# Altium project 5-SignalLight.PrjPcb (part 2 of 2)

## Sheet signal-light-10.SchDoc
size A4; SheetNumber: 13; SheetTotal: 21
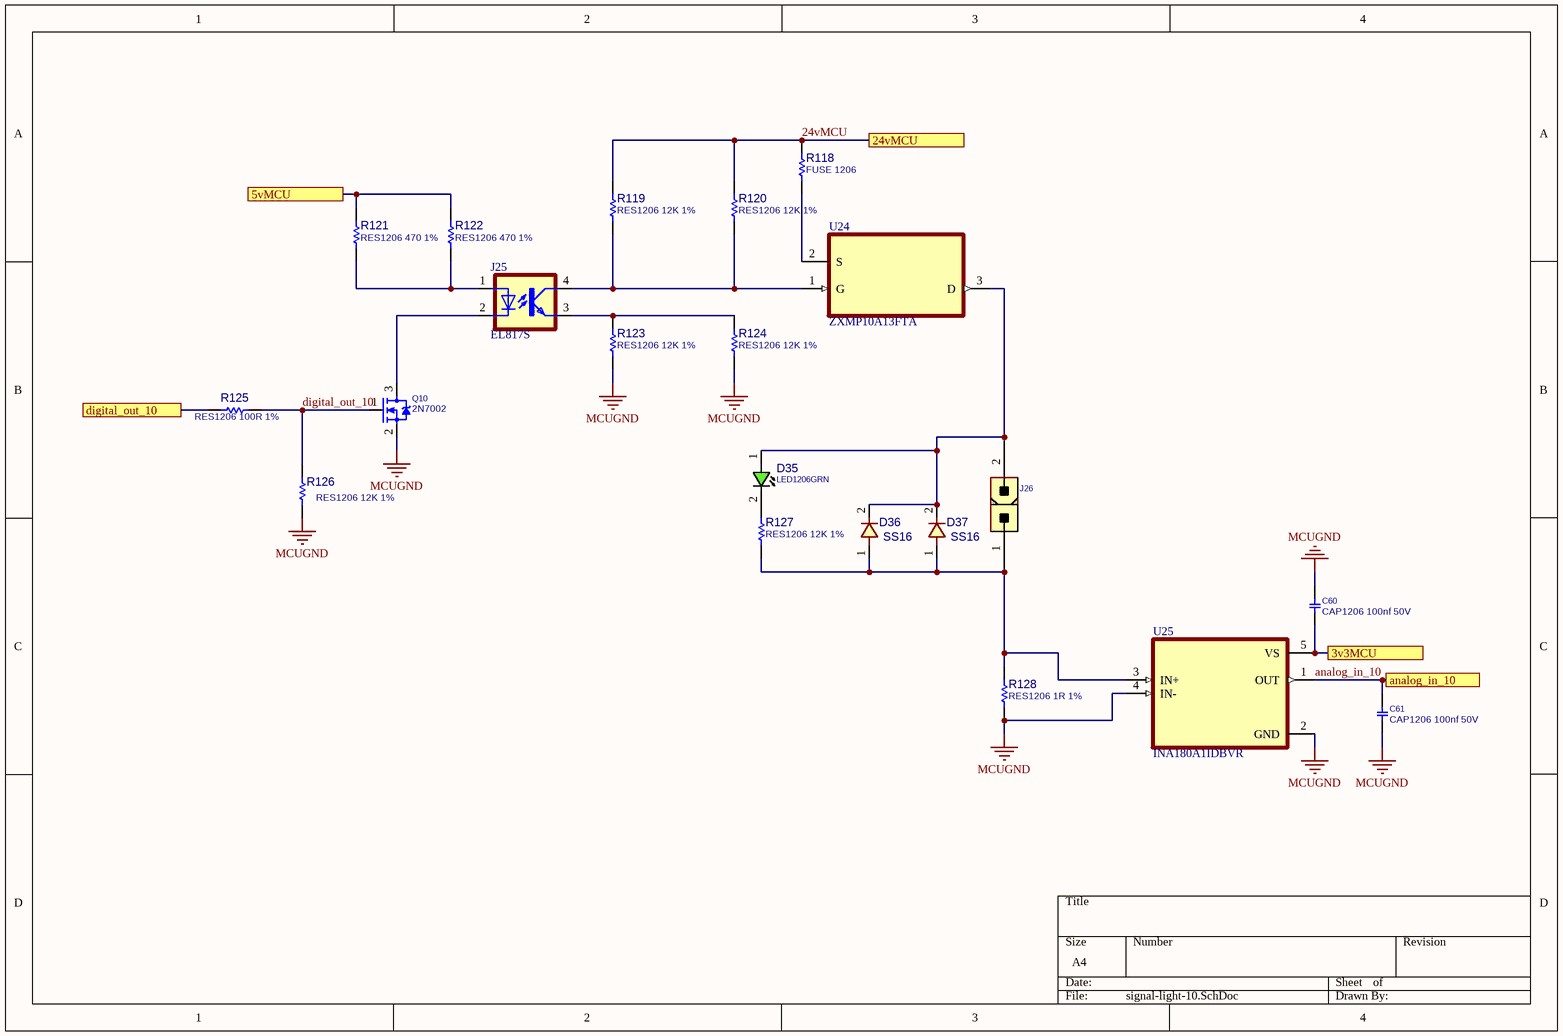
[diagram p12: signal-light-10.SchDoc]

### Parts
C60  CAP1206 100nf 50V  [C1206]
C61  CAP1206 100nf 50V  [C1206]
D35  LED1206GRN  [LED1206GRN]
D36  SS16  [D_SMA]
D37  SS16  [D_SMA]
J25  EL817S  [SOIC254P1030X460-4N]
J26  CONN_ATXPWR_2  [ATXPWR_2]  (value not drawn)
Q10  2N7002  [SOT23_3]
R118  FUSE 1206  [R1206]
R119  RES1206 12K 1%  [R1206]
R120  RES1206 12K 1%  [R1206]
R121  RES1206 470 1%  [R1206]
R122  RES1206 470 1%  [R1206]
R123  RES1206 12K 1%  [R1206]
R124  RES1206 12K 1%  [R1206]
R125  RES1206 100R 1%  [R1206]
R126  RES1206 12K 1%  [R1206]
R127  RES1206 12K 1%  [R1206]
R128  RES1206 1R 1%  [R1206]
U24  ZXMP10A13FTA  [SOT95P230X110-3N]
U25  INA180A1IDBVR  [SOT95P280X145-5N]

### Ports
3v3MCU, 5vMCU, 24vMCU, analog_in_10, digital_out_10

### Nets
MCUGND: C60.1 C61.2 Q10.2(SOURCE) R123.2 R124.2 R126.2 R128.2 U25.2(GND) U25.4(IN-)
3v3MCU: C60.2 U25.5(VS) ; port 3v3MCU
5vMCU: R121.2 R122.2 ; port 5vMCU
24vMCU: R118.1 R119.1 R120.1 ; port 24vMCU
analog_in_10: C61.1 U25.1(OUT) ; port analog_in_10
digital_out_10: Q10.1(GATE) R125.2 R126.1
NetD35_1: D35.1(ANODE) D36.2 D37.2 J26.2 U24.3(D)
NetD35_2: D35.2(CATHODE) R127.1
NetD36_1: D36.1 D37.1 J26.1 R127.2 R128.1 U25.3(IN+)
NetJ25_1: J25.1(A) R121.1 R122.1
NetJ25_2: J25.2(C) Q10.3(DRAIN)
NetJ25_3: J25.3(EMIT) R123.1 R124.1
NetJ25_4: J25.4(COL) R119.2 R120.2 U24.1(G)
NetR118_2: R118.2 U24.2(S)
NetR125_1: R125.1 ; port digital_out_10

### Library data of the parts
C60 C61 = CAP_SMD_MLCC_1206: CAP, MLCC; PARAM: -, -%; MANF_P#: MANF_PART#; PARAM2: -V; PRICE: 100= 1$; MANF: -; ASSEMBLY: ASSEMBLY
D35 = LED_SMD_1206_GRN: LED, SMD, 1206, GREEN; PARAM: 20mA; DESC: DESCRIPTION; PARAM2: 2.2V; MANF: -; ASSEMBLY: ASSEMBLY; PRICE: 36t@Javan; MANF_P#: -; VALUE: LED1206GRN; MountType: SMT; PartType: LED
D36 D37 = DIODE_SMD_1N4001: DIODE, GENERAL PURPOSE, 50V/1A; DESC: DESCRIPTION; PARAM: 50V VRRM; PARAM2: 1A; MANF_P#: 1N4001; MANF: MANF; ASSEMBLY: ASSEMBLY; PRICE: PRICE; VALUE: SS16
J25 = EL817S: Optoisolator Transistor Output 5000Vrms 1 Channel 4-SMD; MF: Everlight Electronics; SnapEDA_Link: https://www.snapeda.com/parts/EL817S/Everlight+Electronics+Co+Ltd/view-part/?ref=snap; Package: SMD-4 Everlight Electronics Co Ltd; Value: *; MP: EL817S; Check_prices: https://www.snapeda.com/parts/EL817S/Everlight+Electronics+Co+Ltd/view-part/?ref=eda
J26 = CONN_ATXPWR_2: CONN, ATX POWER, 2 P; MANF: Molex; MANF_P#: 39281023; VALUE: CONN_ATXPWR_2; MountType: THD; PACKAGE: ATXPWR-2pin; Part Type: Conn.
Q10 = MOSN_2N7002_SOT23: MOSFET, N-CH, 60V, 0.3A; MANF: NXP; ASSEMBLY: ASSEMBLY; MANF_P#: 2N7002; PARAM2: 60v; PARAM: 0.3A; PRICE: 0.3t@Javan; VALUE: 2N7002
R118-R128 = RES_SMD_1206: RESISTOR, SMD; PARAM: 1%, 0.25W; DESC: DESCRIPTION; DIST#: MOUSER; MANF_P#: -; MANF: -; ASSEMBLY: ASSEMBLY; PRICE: -; PARAM2: -
U24 = ZXMP10A13FTA: P-Channel 100 V 600mA (Ta) 625mW (Ta) Surface Mount SOT-23-3; MF: Diodes Inc.; Purchase-URL: https://pricing.snapeda.com/search/part/ZXMP10A13FTA/?ref=eda; Package: SOT-23-3 Diodes Inc.; SnapEDA_Link: https://www.snapeda.com/parts/ZXMP10A13FTA/Diodes+Inc./view-part/?ref=snap; Availability: In Stock; Value: *; MP: ZXMP10A13FTA; Check_prices: https://www.snapeda.com/parts/ZXMP10A13FTA/Diodes+Inc./view-part/?ref=eda; Price: None
U25 = INA180A1IDBVR: 26V, 350kHz current sense amplifier; MF: Texas Instruments; SnapEDA_Link: https://www.snapeda.com/parts/INA180A1IDBVR/Texas+Instruments/view-part/?ref=snap; Package: SOT-23-5 Texas Instruments; Value: *; MP: INA180A1IDBVR; Check_prices: https://www.snapeda.com/parts/INA180A1IDBVR/Texas+Instruments/view-part/?ref=eda

## Sheet signal-light-11.SchDoc
size A4; SheetNumber: 14; SheetTotal: 21
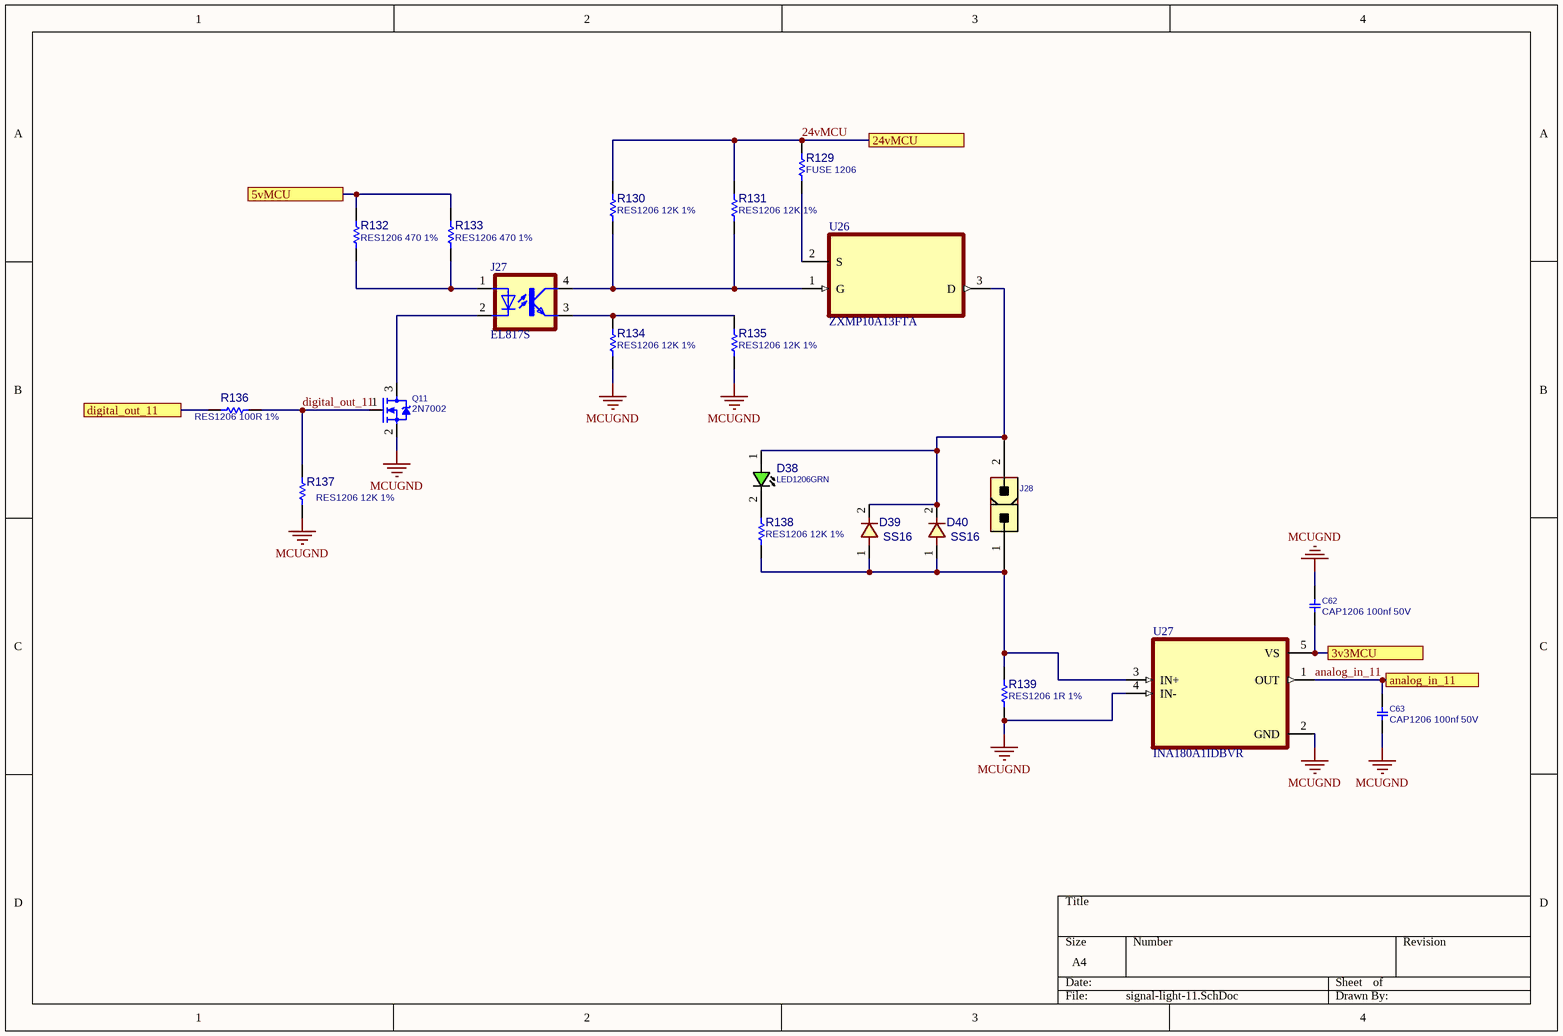
[diagram p13: signal-light-11.SchDoc]

### Parts
C62  CAP1206 100nf 50V  [C1206]
C63  CAP1206 100nf 50V  [C1206]
D38  LED1206GRN  [LED1206GRN]
D39  SS16  [D_SMA]
D40  SS16  [D_SMA]
J27  EL817S  [SOIC254P1030X460-4N]
J28  CONN_ATXPWR_2  [ATXPWR_2]  (value not drawn)
Q11  2N7002  [SOT23_3]
R129  FUSE 1206  [R1206]
R130  RES1206 12K 1%  [R1206]
R131  RES1206 12K 1%  [R1206]
R132  RES1206 470 1%  [R1206]
R133  RES1206 470 1%  [R1206]
R134  RES1206 12K 1%  [R1206]
R135  RES1206 12K 1%  [R1206]
R136  RES1206 100R 1%  [R1206]
R137  RES1206 12K 1%  [R1206]
R138  RES1206 12K 1%  [R1206]
R139  RES1206 1R 1%  [R1206]
U26  ZXMP10A13FTA  [SOT95P230X110-3N]
U27  INA180A1IDBVR  [SOT95P280X145-5N]

### Ports
3v3MCU, 5vMCU, 24vMCU, analog_in_11, digital_out_11

### Nets
MCUGND: C62.1 C63.2 Q11.2(SOURCE) R134.2 R135.2 R137.2 R139.2 U27.2(GND) U27.4(IN-)
3v3MCU: C62.2 U27.5(VS) ; port 3v3MCU
5vMCU: R132.2 R133.2 ; port 5vMCU
24vMCU: R129.1 R130.1 R131.1 ; port 24vMCU
analog_in_11: C63.1 U27.1(OUT) ; port analog_in_11
digital_out_11: Q11.1(GATE) R136.2 R137.1
NetD38_1: D38.1(ANODE) D39.2 D40.2 J28.2 U26.3(D)
NetD38_2: D38.2(CATHODE) R138.1
NetD39_1: D39.1 D40.1 J28.1 R138.2 R139.1 U27.3(IN+)
NetJ27_1: J27.1(A) R132.1 R133.1
NetJ27_2: J27.2(C) Q11.3(DRAIN)
NetJ27_3: J27.3(EMIT) R134.1 R135.1
NetJ27_4: J27.4(COL) R130.2 R131.2 U26.1(G)
NetR129_2: R129.2 U26.2(S)
NetR136_1: R136.1 ; port digital_out_11

### Library data of the parts
C62 C63 = CAP_SMD_MLCC_1206: as C60 on sheet signal-light-10; PRICE: 100= 1$; MANF: -; ASSEMBLY: ASSEMBLY
D38 = LED_SMD_1206_GRN: as D35 on sheet signal-light-10; MANF: -; ASSEMBLY: ASSEMBLY; PRICE: 36t@Javan; MANF_P#: -; VALUE: LED1206GRN; MountType: SMT; PartType: LED
D39 D40 = DIODE_SMD_1N4001: as D36 on sheet signal-light-10; MANF: MANF; ASSEMBLY: ASSEMBLY; PRICE: PRICE; VALUE: SS16
J27 = EL817S: as J25 on sheet signal-light-10; SnapEDA_Link: https://www.snapeda.com/parts/EL817S/Everlight+Electronics+Co+Ltd/view-part/?ref=snap; Package: SMD-4 Everlight Electronics Co Ltd; Value: *; MP: EL817S; Check_prices: https://www.snapeda.com/parts/EL817S/Everlight+Electronics+Co+Ltd/view-part/?ref=eda
J28 = CONN_ATXPWR_2: as J26 on sheet signal-light-10; VALUE: CONN_ATXPWR_2; MountType: THD; PACKAGE: ATXPWR-2pin; Part Type: Conn.
Q11 = MOSN_2N7002_SOT23: MOSFET, N-CH, 60V, 0.3A; MANF: NXP; ASSEMBLY: ASSEMBLY; MANF_P#: 2N7002; PARAM2: 60v; PARAM: 0.3A; PRICE: 0.3t@Javan; VALUE: 2N7002
R129-R139 = RES_SMD_1206: as R118 on sheet signal-light-10; MANF_P#: -; MANF: -; ASSEMBLY: ASSEMBLY; PRICE: -; PARAM2: -
U26 = ZXMP10A13FTA: as U24 on sheet signal-light-10; Purchase-URL: https://pricing.snapeda.com/search/part/ZXMP10A13FTA/?ref=eda; Package: SOT-23-3 Diodes Inc.; SnapEDA_Link: https://www.snapeda.com/parts/ZXMP10A13FTA/Diodes+Inc./view-part/?ref=snap; Availability: In Stock; Value: *; MP: ZXMP10A13FTA; Check_prices: https://www.snapeda.com/parts/ZXMP10A13FTA/Diodes+Inc./view-part/?ref=eda; Price: None
U27 = INA180A1IDBVR: as U25 on sheet signal-light-10; SnapEDA_Link: https://www.snapeda.com/parts/INA180A1IDBVR/Texas+Instruments/view-part/?ref=snap; Package: SOT-23-5 Texas Instruments; Value: *; MP: INA180A1IDBVR; Check_prices: https://www.snapeda.com/parts/INA180A1IDBVR/Texas+Instruments/view-part/?ref=eda

## Sheet signal-light-12.SchDoc
size A4; SheetNumber: 15; SheetTotal: 21
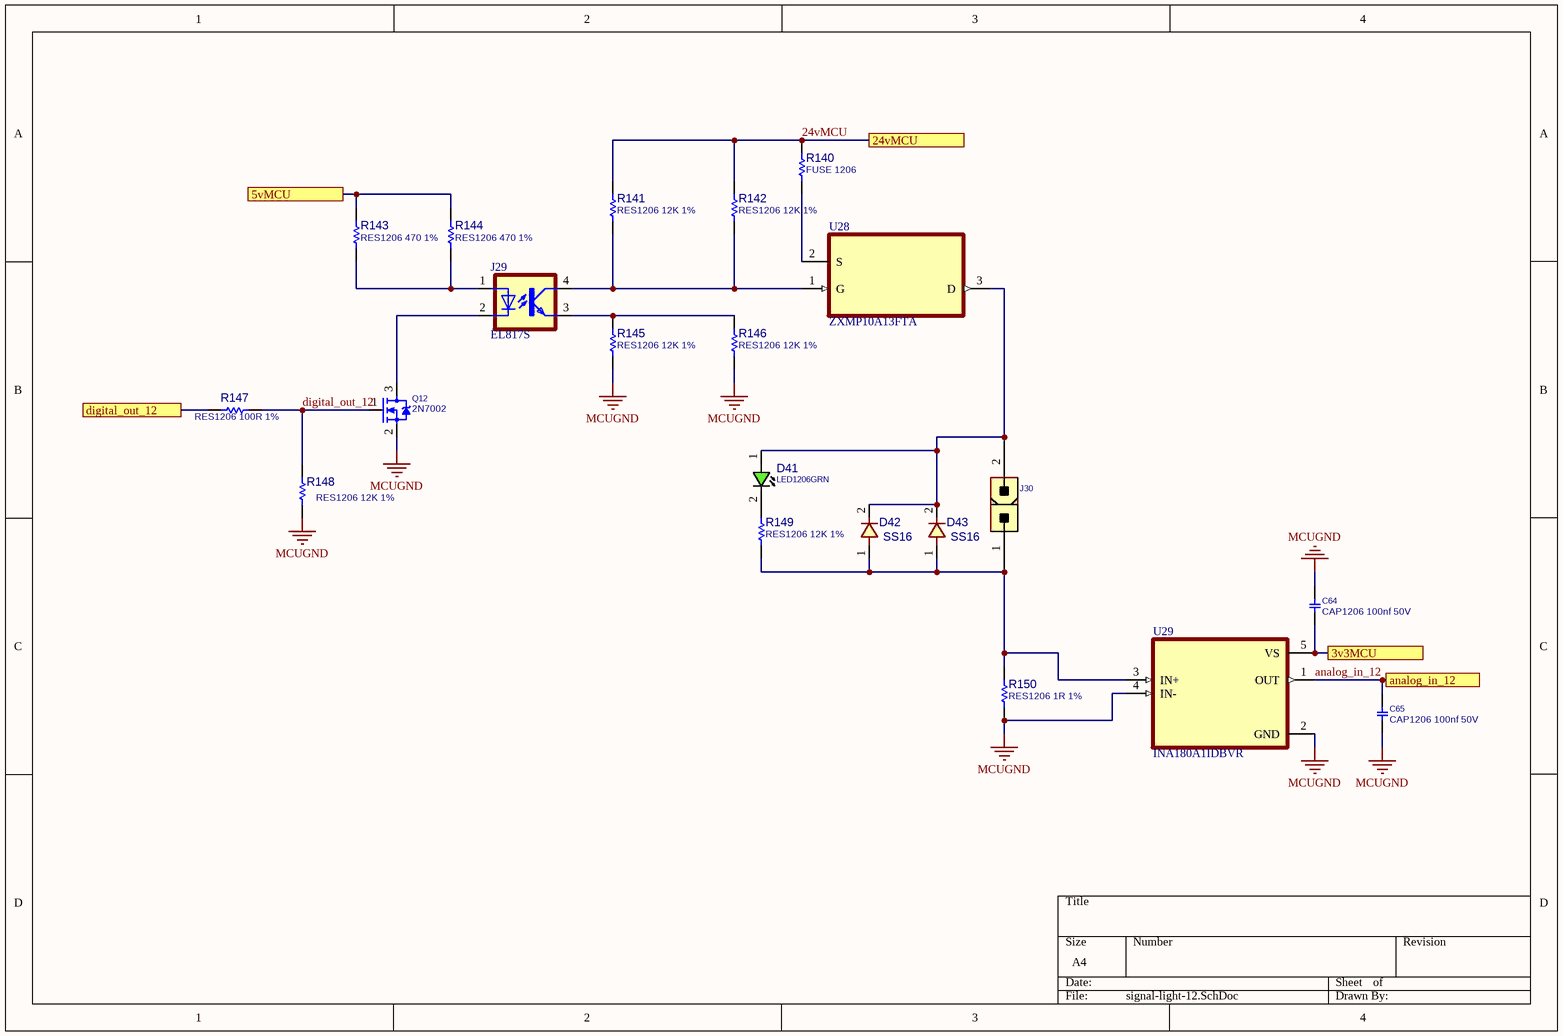
[diagram p14: signal-light-12.SchDoc]

### Parts
C64  CAP1206 100nf 50V  [C1206]
C65  CAP1206 100nf 50V  [C1206]
D41  LED1206GRN  [LED1206GRN]
D42  SS16  [D_SMA]
D43  SS16  [D_SMA]
J29  EL817S  [SOIC254P1030X460-4N]
J30  CONN_ATXPWR_2  [ATXPWR_2]  (value not drawn)
Q12  2N7002  [SOT23_3]
R140  FUSE 1206  [R1206]
R141  RES1206 12K 1%  [R1206]
R142  RES1206 12K 1%  [R1206]
R143  RES1206 470 1%  [R1206]
R144  RES1206 470 1%  [R1206]
R145  RES1206 12K 1%  [R1206]
R146  RES1206 12K 1%  [R1206]
R147  RES1206 100R 1%  [R1206]
R148  RES1206 12K 1%  [R1206]
R149  RES1206 12K 1%  [R1206]
R150  RES1206 1R 1%  [R1206]
U28  ZXMP10A13FTA  [SOT95P230X110-3N]
U29  INA180A1IDBVR  [SOT95P280X145-5N]

### Ports
3v3MCU, 5vMCU, 24vMCU, analog_in_12, digital_out_12

### Nets
MCUGND: C64.1 C65.2 Q12.2(SOURCE) R145.2 R146.2 R148.2 R150.2 U29.2(GND) U29.4(IN-)
3v3MCU: C64.2 U29.5(VS) ; port 3v3MCU
5vMCU: R143.2 R144.2 ; port 5vMCU
24vMCU: R140.1 R141.1 R142.1 ; port 24vMCU
analog_in_12: C65.1 U29.1(OUT) ; port analog_in_12
digital_out_12: Q12.1(GATE) R147.2 R148.1
NetD41_1: D41.1(ANODE) D42.2 D43.2 J30.2 U28.3(D)
NetD41_2: D41.2(CATHODE) R149.1
NetD42_1: D42.1 D43.1 J30.1 R149.2 R150.1 U29.3(IN+)
NetJ29_1: J29.1(A) R143.1 R144.1
NetJ29_2: J29.2(C) Q12.3(DRAIN)
NetJ29_3: J29.3(EMIT) R145.1 R146.1
NetJ29_4: J29.4(COL) R141.2 R142.2 U28.1(G)
NetR140_2: R140.2 U28.2(S)
NetR147_1: R147.1 ; port digital_out_12

### Library data of the parts
C64 C65 = CAP_SMD_MLCC_1206: as C60 on sheet signal-light-10; PRICE: 100= 1$; MANF: -; ASSEMBLY: ASSEMBLY
D41 = LED_SMD_1206_GRN: as D35 on sheet signal-light-10; MANF: -; ASSEMBLY: ASSEMBLY; PRICE: 36t@Javan; MANF_P#: -; VALUE: LED1206GRN; MountType: SMT; PartType: LED
D42 D43 = DIODE_SMD_1N4001: as D36 on sheet signal-light-10; MANF: MANF; ASSEMBLY: ASSEMBLY; PRICE: PRICE; VALUE: SS16
J29 = EL817S: as J25 on sheet signal-light-10; SnapEDA_Link: https://www.snapeda.com/parts/EL817S/Everlight+Electronics+Co+Ltd/view-part/?ref=snap; Package: SMD-4 Everlight Electronics Co Ltd; Value: *; MP: EL817S; Check_prices: https://www.snapeda.com/parts/EL817S/Everlight+Electronics+Co+Ltd/view-part/?ref=eda
J30 = CONN_ATXPWR_2: as J26 on sheet signal-light-10; VALUE: CONN_ATXPWR_2; MountType: THD; PACKAGE: ATXPWR-2pin; Part Type: Conn.
Q12 = MOSN_2N7002_SOT23: MOSFET, N-CH, 60V, 0.3A; MANF: NXP; ASSEMBLY: ASSEMBLY; MANF_P#: 2N7002; PARAM2: 60v; PARAM: 0.3A; PRICE: 0.3t@Javan; VALUE: 2N7002
R140-R150 = RES_SMD_1206: as R118 on sheet signal-light-10; MANF_P#: -; MANF: -; ASSEMBLY: ASSEMBLY; PRICE: -; PARAM2: -
U28 = ZXMP10A13FTA: as U24 on sheet signal-light-10; Purchase-URL: https://pricing.snapeda.com/search/part/ZXMP10A13FTA/?ref=eda; Package: SOT-23-3 Diodes Inc.; SnapEDA_Link: https://www.snapeda.com/parts/ZXMP10A13FTA/Diodes+Inc./view-part/?ref=snap; Availability: In Stock; Value: *; MP: ZXMP10A13FTA; Check_prices: https://www.snapeda.com/parts/ZXMP10A13FTA/Diodes+Inc./view-part/?ref=eda; Price: None
U29 = INA180A1IDBVR: as U25 on sheet signal-light-10; SnapEDA_Link: https://www.snapeda.com/parts/INA180A1IDBVR/Texas+Instruments/view-part/?ref=snap; Package: SOT-23-5 Texas Instruments; Value: *; MP: INA180A1IDBVR; Check_prices: https://www.snapeda.com/parts/INA180A1IDBVR/Texas+Instruments/view-part/?ref=eda

## Sheet signal-light-13.SchDoc
size A4; SheetNumber: 16; SheetTotal: 21
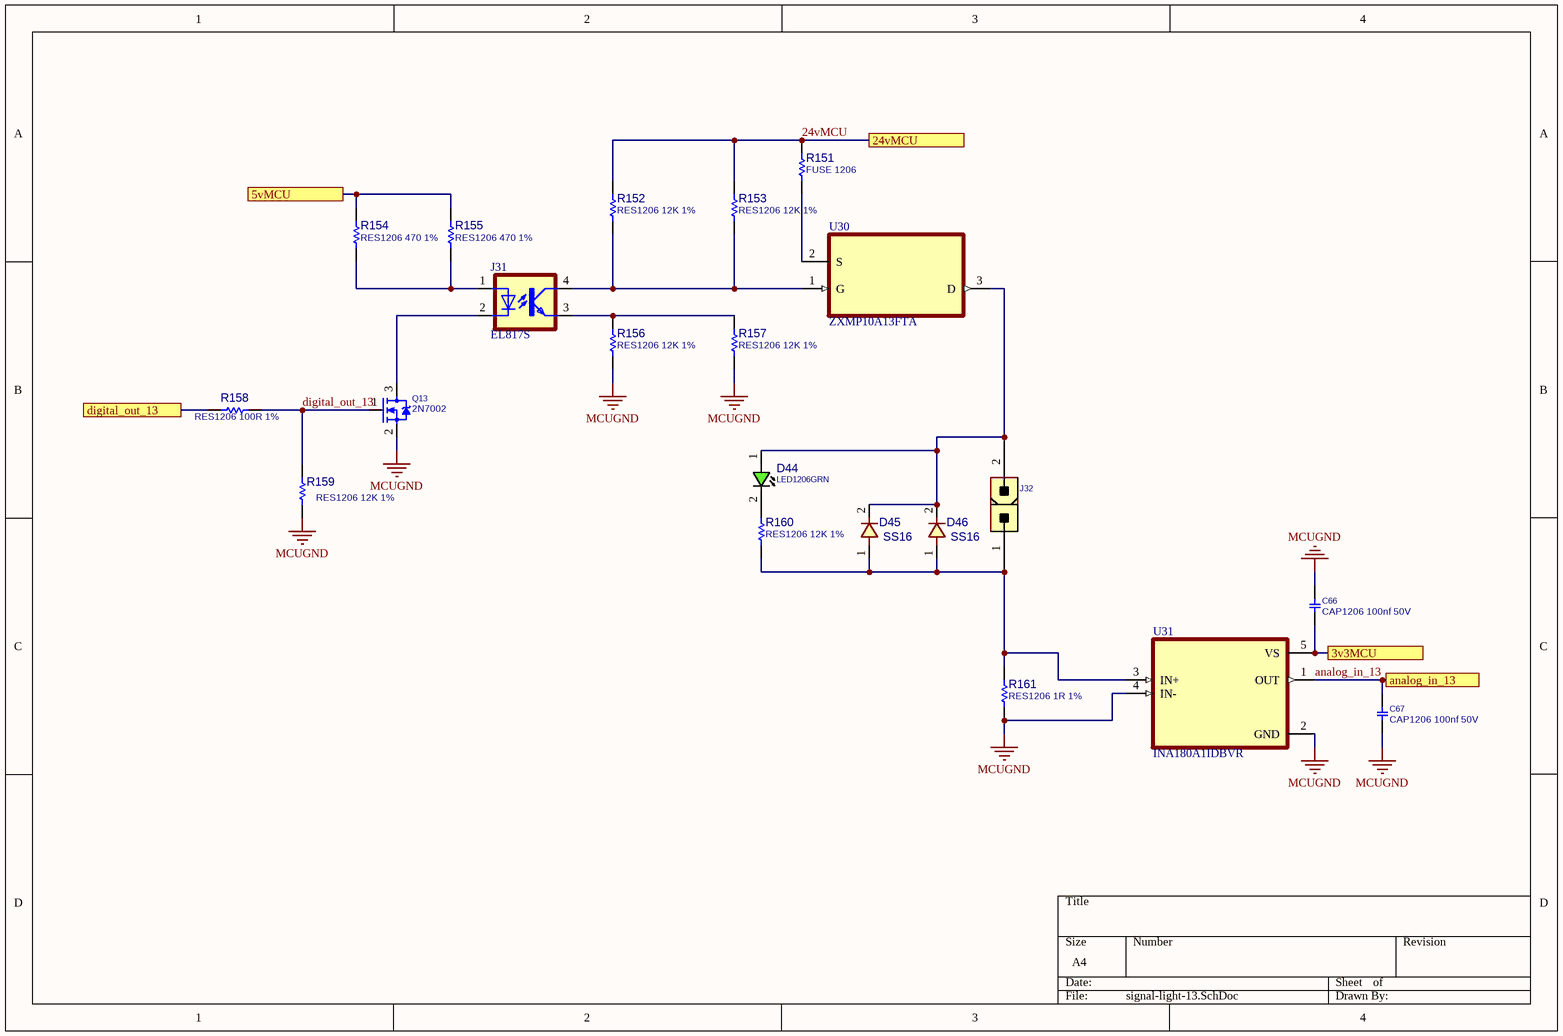
[diagram p15: signal-light-13.SchDoc]

### Parts
C66  CAP1206 100nf 50V  [C1206]
C67  CAP1206 100nf 50V  [C1206]
D44  LED1206GRN  [LED1206GRN]
D45  SS16  [D_SMA]
D46  SS16  [D_SMA]
J31  EL817S  [SOIC254P1030X460-4N]
J32  CONN_ATXPWR_2  [ATXPWR_2]  (value not drawn)
Q13  2N7002  [SOT23_3]
R151  FUSE 1206  [R1206]
R152  RES1206 12K 1%  [R1206]
R153  RES1206 12K 1%  [R1206]
R154  RES1206 470 1%  [R1206]
R155  RES1206 470 1%  [R1206]
R156  RES1206 12K 1%  [R1206]
R157  RES1206 12K 1%  [R1206]
R158  RES1206 100R 1%  [R1206]
R159  RES1206 12K 1%  [R1206]
R160  RES1206 12K 1%  [R1206]
R161  RES1206 1R 1%  [R1206]
U30  ZXMP10A13FTA  [SOT95P230X110-3N]
U31  INA180A1IDBVR  [SOT95P280X145-5N]

### Ports
3v3MCU, 5vMCU, 24vMCU, analog_in_13, digital_out_13

### Nets
MCUGND: C66.1 C67.2 Q13.2(SOURCE) R156.2 R157.2 R159.2 R161.2 U31.2(GND) U31.4(IN-)
3v3MCU: C66.2 U31.5(VS) ; port 3v3MCU
5vMCU: R154.2 R155.2 ; port 5vMCU
24vMCU: R151.1 R152.1 R153.1 ; port 24vMCU
analog_in_13: C67.1 U31.1(OUT) ; port analog_in_13
digital_out_13: Q13.1(GATE) R158.2 R159.1
NetD44_1: D44.1(ANODE) D45.2 D46.2 J32.2 U30.3(D)
NetD44_2: D44.2(CATHODE) R160.1
NetD45_1: D45.1 D46.1 J32.1 R160.2 R161.1 U31.3(IN+)
NetJ31_1: J31.1(A) R154.1 R155.1
NetJ31_2: J31.2(C) Q13.3(DRAIN)
NetJ31_3: J31.3(EMIT) R156.1 R157.1
NetJ31_4: J31.4(COL) R152.2 R153.2 U30.1(G)
NetR151_2: R151.2 U30.2(S)
NetR158_1: R158.1 ; port digital_out_13

### Library data of the parts
C66 C67 = CAP_SMD_MLCC_1206: as C60 on sheet signal-light-10; PRICE: 100= 1$; MANF: -; ASSEMBLY: ASSEMBLY
D44 = LED_SMD_1206_GRN: as D35 on sheet signal-light-10; MANF: -; ASSEMBLY: ASSEMBLY; PRICE: 36t@Javan; MANF_P#: -; VALUE: LED1206GRN; MountType: SMT; PartType: LED
D45 D46 = DIODE_SMD_1N4001: as D36 on sheet signal-light-10; MANF: MANF; ASSEMBLY: ASSEMBLY; PRICE: PRICE; VALUE: SS16
J31 = EL817S: as J25 on sheet signal-light-10; SnapEDA_Link: https://www.snapeda.com/parts/EL817S/Everlight+Electronics+Co+Ltd/view-part/?ref=snap; Package: SMD-4 Everlight Electronics Co Ltd; Value: *; MP: EL817S; Check_prices: https://www.snapeda.com/parts/EL817S/Everlight+Electronics+Co+Ltd/view-part/?ref=eda
J32 = CONN_ATXPWR_2: as J26 on sheet signal-light-10; VALUE: CONN_ATXPWR_2; MountType: THD; PACKAGE: ATXPWR-2pin; Part Type: Conn.
Q13 = MOSN_2N7002_SOT23: MOSFET, N-CH, 60V, 0.3A; MANF: NXP; ASSEMBLY: ASSEMBLY; MANF_P#: 2N7002; PARAM2: 60v; PARAM: 0.3A; PRICE: 0.3t@Javan; VALUE: 2N7002
R151-R161 = RES_SMD_1206: as R118 on sheet signal-light-10; MANF_P#: -; MANF: -; ASSEMBLY: ASSEMBLY; PRICE: -; PARAM2: -
U30 = ZXMP10A13FTA: as U24 on sheet signal-light-10; Purchase-URL: https://pricing.snapeda.com/search/part/ZXMP10A13FTA/?ref=eda; Package: SOT-23-3 Diodes Inc.; SnapEDA_Link: https://www.snapeda.com/parts/ZXMP10A13FTA/Diodes+Inc./view-part/?ref=snap; Availability: In Stock; Value: *; MP: ZXMP10A13FTA; Check_prices: https://www.snapeda.com/parts/ZXMP10A13FTA/Diodes+Inc./view-part/?ref=eda; Price: None
U31 = INA180A1IDBVR: as U25 on sheet signal-light-10; SnapEDA_Link: https://www.snapeda.com/parts/INA180A1IDBVR/Texas+Instruments/view-part/?ref=snap; Package: SOT-23-5 Texas Instruments; Value: *; MP: INA180A1IDBVR; Check_prices: https://www.snapeda.com/parts/INA180A1IDBVR/Texas+Instruments/view-part/?ref=eda

## Sheet signal-light-14.SchDoc
size A4; SheetNumber: 17; SheetTotal: 21
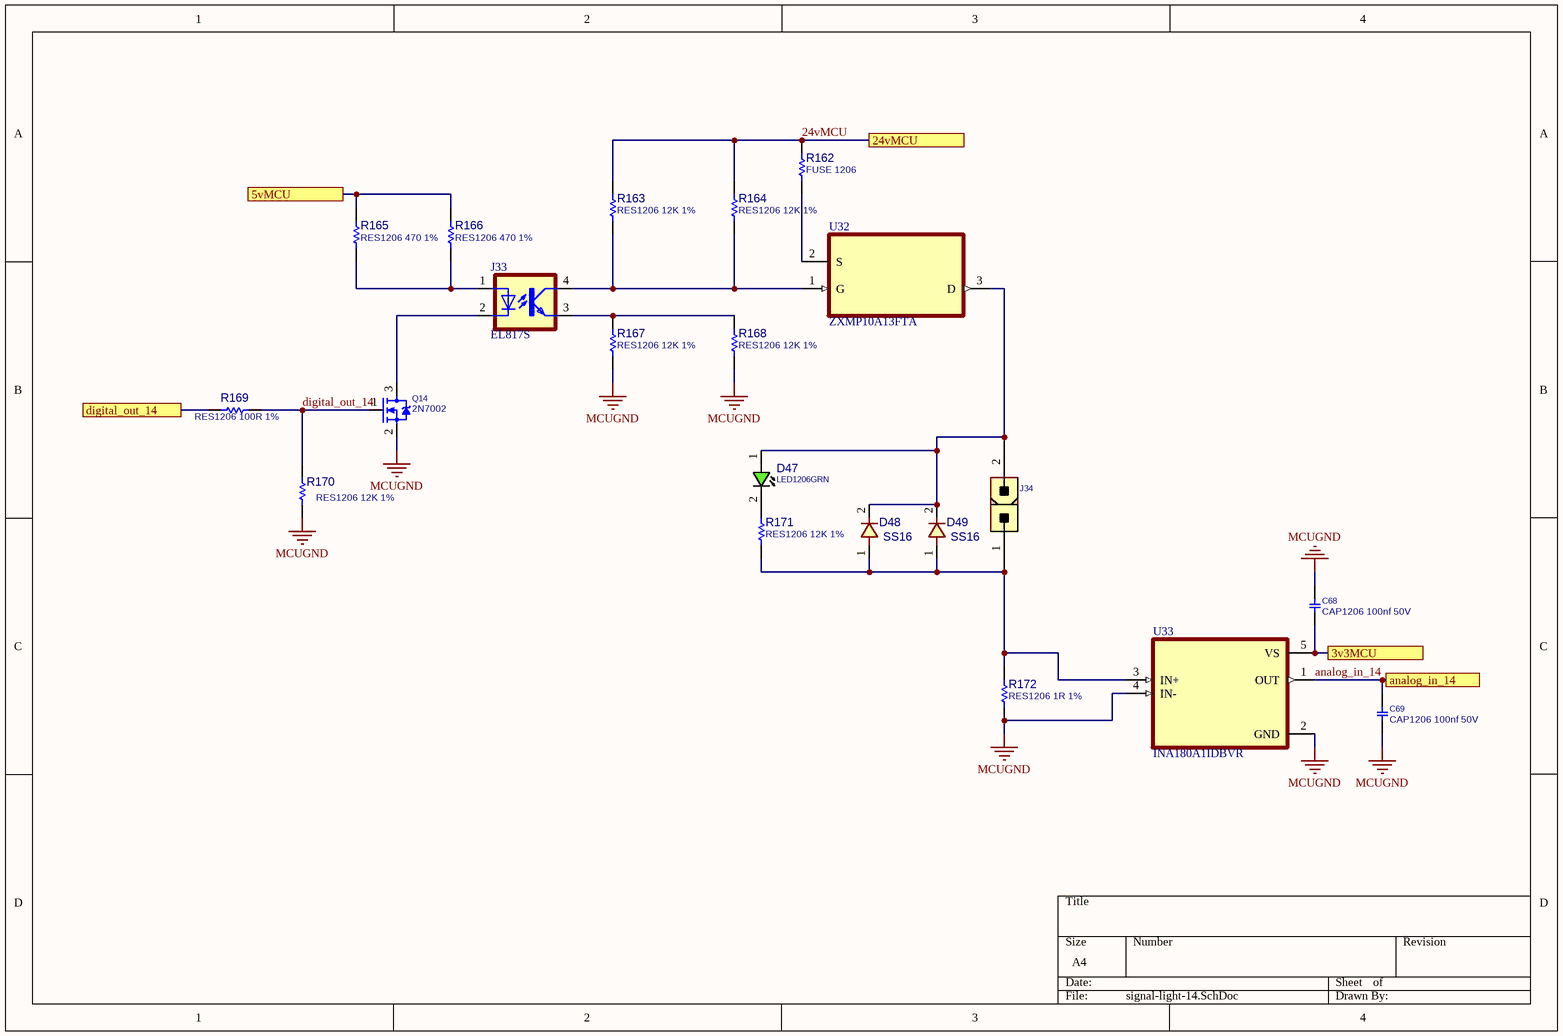
[diagram p16: signal-light-14.SchDoc]

### Parts
C68  CAP1206 100nf 50V  [C1206]
C69  CAP1206 100nf 50V  [C1206]
D47  LED1206GRN  [LED1206GRN]
D48  SS16  [D_SMA]
D49  SS16  [D_SMA]
J33  EL817S  [SOIC254P1030X460-4N]
J34  CONN_ATXPWR_2  [ATXPWR_2]  (value not drawn)
Q14  2N7002  [SOT23_3]
R162  FUSE 1206  [R1206]
R163  RES1206 12K 1%  [R1206]
R164  RES1206 12K 1%  [R1206]
R165  RES1206 470 1%  [R1206]
R166  RES1206 470 1%  [R1206]
R167  RES1206 12K 1%  [R1206]
R168  RES1206 12K 1%  [R1206]
R169  RES1206 100R 1%  [R1206]
R170  RES1206 12K 1%  [R1206]
R171  RES1206 12K 1%  [R1206]
R172  RES1206 1R 1%  [R1206]
U32  ZXMP10A13FTA  [SOT95P230X110-3N]
U33  INA180A1IDBVR  [SOT95P280X145-5N]

### Ports
3v3MCU, 5vMCU, 24vMCU, analog_in_14, digital_out_14

### Nets
MCUGND: C68.1 C69.2 Q14.2(SOURCE) R167.2 R168.2 R170.2 R172.2 U33.2(GND) U33.4(IN-)
3v3MCU: C68.2 U33.5(VS) ; port 3v3MCU
5vMCU: R165.2 R166.2 ; port 5vMCU
24vMCU: R162.1 R163.1 R164.1 ; port 24vMCU
analog_in_14: C69.1 U33.1(OUT) ; port analog_in_14
digital_out_14: Q14.1(GATE) R169.2 R170.1
NetD47_1: D47.1(ANODE) D48.2 D49.2 J34.2 U32.3(D)
NetD47_2: D47.2(CATHODE) R171.1
NetD48_1: D48.1 D49.1 J34.1 R171.2 R172.1 U33.3(IN+)
NetJ33_1: J33.1(A) R165.1 R166.1
NetJ33_2: J33.2(C) Q14.3(DRAIN)
NetJ33_3: J33.3(EMIT) R167.1 R168.1
NetJ33_4: J33.4(COL) R163.2 R164.2 U32.1(G)
NetR162_2: R162.2 U32.2(S)
NetR169_1: R169.1 ; port digital_out_14

### Library data of the parts
C68 C69 = CAP_SMD_MLCC_1206: as C60 on sheet signal-light-10; PRICE: 100= 1$; MANF: -; ASSEMBLY: ASSEMBLY
D47 = LED_SMD_1206_GRN: as D35 on sheet signal-light-10; MANF: -; ASSEMBLY: ASSEMBLY; PRICE: 36t@Javan; MANF_P#: -; VALUE: LED1206GRN; MountType: SMT; PartType: LED
D48 D49 = DIODE_SMD_1N4001: as D36 on sheet signal-light-10; MANF: MANF; ASSEMBLY: ASSEMBLY; PRICE: PRICE; VALUE: SS16
J33 = EL817S: as J25 on sheet signal-light-10; SnapEDA_Link: https://www.snapeda.com/parts/EL817S/Everlight+Electronics+Co+Ltd/view-part/?ref=snap; Package: SMD-4 Everlight Electronics Co Ltd; Value: *; MP: EL817S; Check_prices: https://www.snapeda.com/parts/EL817S/Everlight+Electronics+Co+Ltd/view-part/?ref=eda
J34 = CONN_ATXPWR_2: as J26 on sheet signal-light-10; VALUE: CONN_ATXPWR_2; MountType: THD; PACKAGE: ATXPWR-2pin; Part Type: Conn.
Q14 = MOSN_2N7002_SOT23: MOSFET, N-CH, 60V, 0.3A; MANF: NXP; ASSEMBLY: ASSEMBLY; MANF_P#: 2N7002; PARAM2: 60v; PARAM: 0.3A; PRICE: 0.3t@Javan; VALUE: 2N7002
R162-R172 = RES_SMD_1206: as R118 on sheet signal-light-10; MANF_P#: -; MANF: -; ASSEMBLY: ASSEMBLY; PRICE: -; PARAM2: -
U32 = ZXMP10A13FTA: as U24 on sheet signal-light-10; Purchase-URL: https://pricing.snapeda.com/search/part/ZXMP10A13FTA/?ref=eda; Package: SOT-23-3 Diodes Inc.; SnapEDA_Link: https://www.snapeda.com/parts/ZXMP10A13FTA/Diodes+Inc./view-part/?ref=snap; Availability: In Stock; Value: *; MP: ZXMP10A13FTA; Check_prices: https://www.snapeda.com/parts/ZXMP10A13FTA/Diodes+Inc./view-part/?ref=eda; Price: None
U33 = INA180A1IDBVR: as U25 on sheet signal-light-10; SnapEDA_Link: https://www.snapeda.com/parts/INA180A1IDBVR/Texas+Instruments/view-part/?ref=snap; Package: SOT-23-5 Texas Instruments; Value: *; MP: INA180A1IDBVR; Check_prices: https://www.snapeda.com/parts/INA180A1IDBVR/Texas+Instruments/view-part/?ref=eda

## Sheet signal-light-15.SchDoc
size A4; SheetNumber: 18; SheetTotal: 21
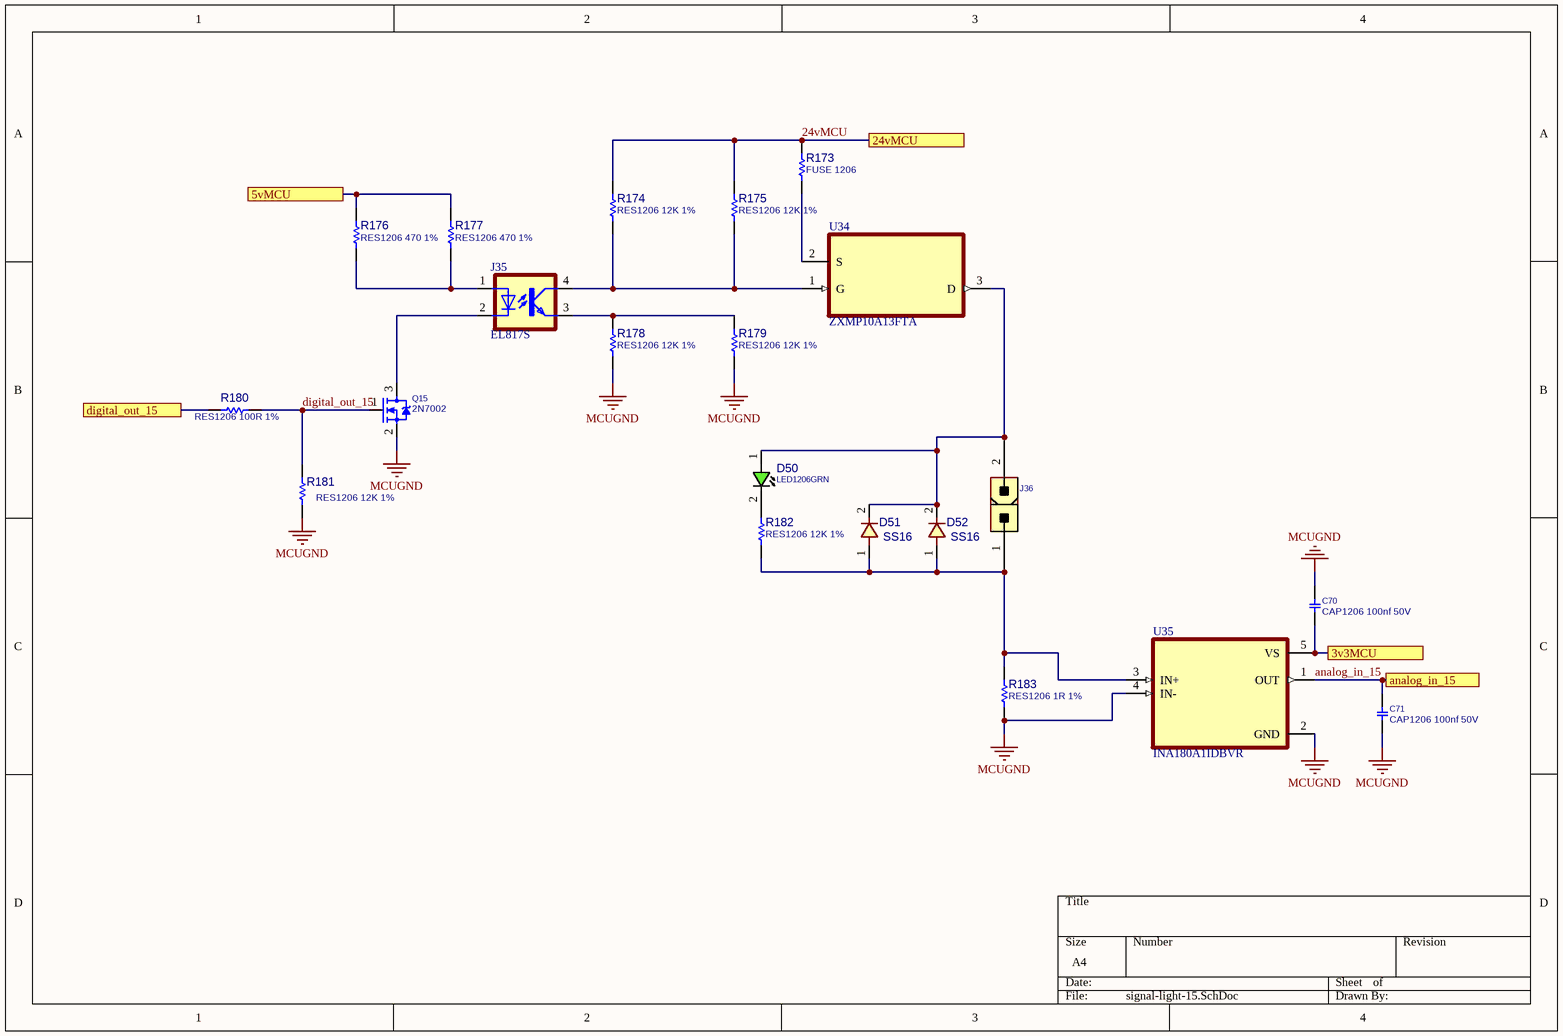
[diagram p17: signal-light-15.SchDoc]

### Parts
C70  CAP1206 100nf 50V  [C1206]
C71  CAP1206 100nf 50V  [C1206]
D50  LED1206GRN  [LED1206GRN]
D51  SS16  [D_SMA]
D52  SS16  [D_SMA]
J35  EL817S  [SOIC254P1030X460-4N]
J36  CONN_ATXPWR_2  [ATXPWR_2]  (value not drawn)
Q15  2N7002  [SOT23_3]
R173  FUSE 1206  [R1206]
R174  RES1206 12K 1%  [R1206]
R175  RES1206 12K 1%  [R1206]
R176  RES1206 470 1%  [R1206]
R177  RES1206 470 1%  [R1206]
R178  RES1206 12K 1%  [R1206]
R179  RES1206 12K 1%  [R1206]
R180  RES1206 100R 1%  [R1206]
R181  RES1206 12K 1%  [R1206]
R182  RES1206 12K 1%  [R1206]
R183  RES1206 1R 1%  [R1206]
U34  ZXMP10A13FTA  [SOT95P230X110-3N]
U35  INA180A1IDBVR  [SOT95P280X145-5N]

### Ports
3v3MCU, 5vMCU, 24vMCU, analog_in_15, digital_out_15

### Nets
MCUGND: C70.1 C71.2 Q15.2(SOURCE) R178.2 R179.2 R181.2 R183.2 U35.2(GND) U35.4(IN-)
3v3MCU: C70.2 U35.5(VS) ; port 3v3MCU
5vMCU: R176.2 R177.2 ; port 5vMCU
24vMCU: R173.1 R174.1 R175.1 ; port 24vMCU
analog_in_15: C71.1 U35.1(OUT) ; port analog_in_15
digital_out_15: Q15.1(GATE) R180.2 R181.1
NetD50_1: D50.1(ANODE) D51.2 D52.2 J36.2 U34.3(D)
NetD50_2: D50.2(CATHODE) R182.1
NetD51_1: D51.1 D52.1 J36.1 R182.2 R183.1 U35.3(IN+)
NetJ35_1: J35.1(A) R176.1 R177.1
NetJ35_2: J35.2(C) Q15.3(DRAIN)
NetJ35_3: J35.3(EMIT) R178.1 R179.1
NetJ35_4: J35.4(COL) R174.2 R175.2 U34.1(G)
NetR173_2: R173.2 U34.2(S)
NetR180_1: R180.1 ; port digital_out_15

### Library data of the parts
C70 C71 = CAP_SMD_MLCC_1206: as C60 on sheet signal-light-10; PRICE: 100= 1$; MANF: -; ASSEMBLY: ASSEMBLY
D50 = LED_SMD_1206_GRN: as D35 on sheet signal-light-10; MANF: -; ASSEMBLY: ASSEMBLY; PRICE: 36t@Javan; MANF_P#: -; VALUE: LED1206GRN; MountType: SMT; PartType: LED
D51 D52 = DIODE_SMD_1N4001: as D36 on sheet signal-light-10; MANF: MANF; ASSEMBLY: ASSEMBLY; PRICE: PRICE; VALUE: SS16
J35 = EL817S: as J25 on sheet signal-light-10; SnapEDA_Link: https://www.snapeda.com/parts/EL817S/Everlight+Electronics+Co+Ltd/view-part/?ref=snap; Package: SMD-4 Everlight Electronics Co Ltd; Value: *; MP: EL817S; Check_prices: https://www.snapeda.com/parts/EL817S/Everlight+Electronics+Co+Ltd/view-part/?ref=eda
J36 = CONN_ATXPWR_2: as J26 on sheet signal-light-10; VALUE: CONN_ATXPWR_2; MountType: THD; PACKAGE: ATXPWR-2pin; Part Type: Conn.
Q15 = MOSN_2N7002_SOT23: MOSFET, N-CH, 60V, 0.3A; MANF: NXP; ASSEMBLY: ASSEMBLY; MANF_P#: 2N7002; PARAM2: 60v; PARAM: 0.3A; PRICE: 0.3t@Javan; VALUE: 2N7002
R173-R183 = RES_SMD_1206: as R118 on sheet signal-light-10; MANF_P#: -; MANF: -; ASSEMBLY: ASSEMBLY; PRICE: -; PARAM2: -
U34 = ZXMP10A13FTA: as U24 on sheet signal-light-10; Purchase-URL: https://pricing.snapeda.com/search/part/ZXMP10A13FTA/?ref=eda; Package: SOT-23-3 Diodes Inc.; SnapEDA_Link: https://www.snapeda.com/parts/ZXMP10A13FTA/Diodes+Inc./view-part/?ref=snap; Availability: In Stock; Value: *; MP: ZXMP10A13FTA; Check_prices: https://www.snapeda.com/parts/ZXMP10A13FTA/Diodes+Inc./view-part/?ref=eda; Price: None
U35 = INA180A1IDBVR: as U25 on sheet signal-light-10; SnapEDA_Link: https://www.snapeda.com/parts/INA180A1IDBVR/Texas+Instruments/view-part/?ref=snap; Package: SOT-23-5 Texas Instruments; Value: *; MP: INA180A1IDBVR; Check_prices: https://www.snapeda.com/parts/INA180A1IDBVR/Texas+Instruments/view-part/?ref=eda

## Sheet signal-light-16.SchDoc
size A4; SheetNumber: 19; SheetTotal: 21
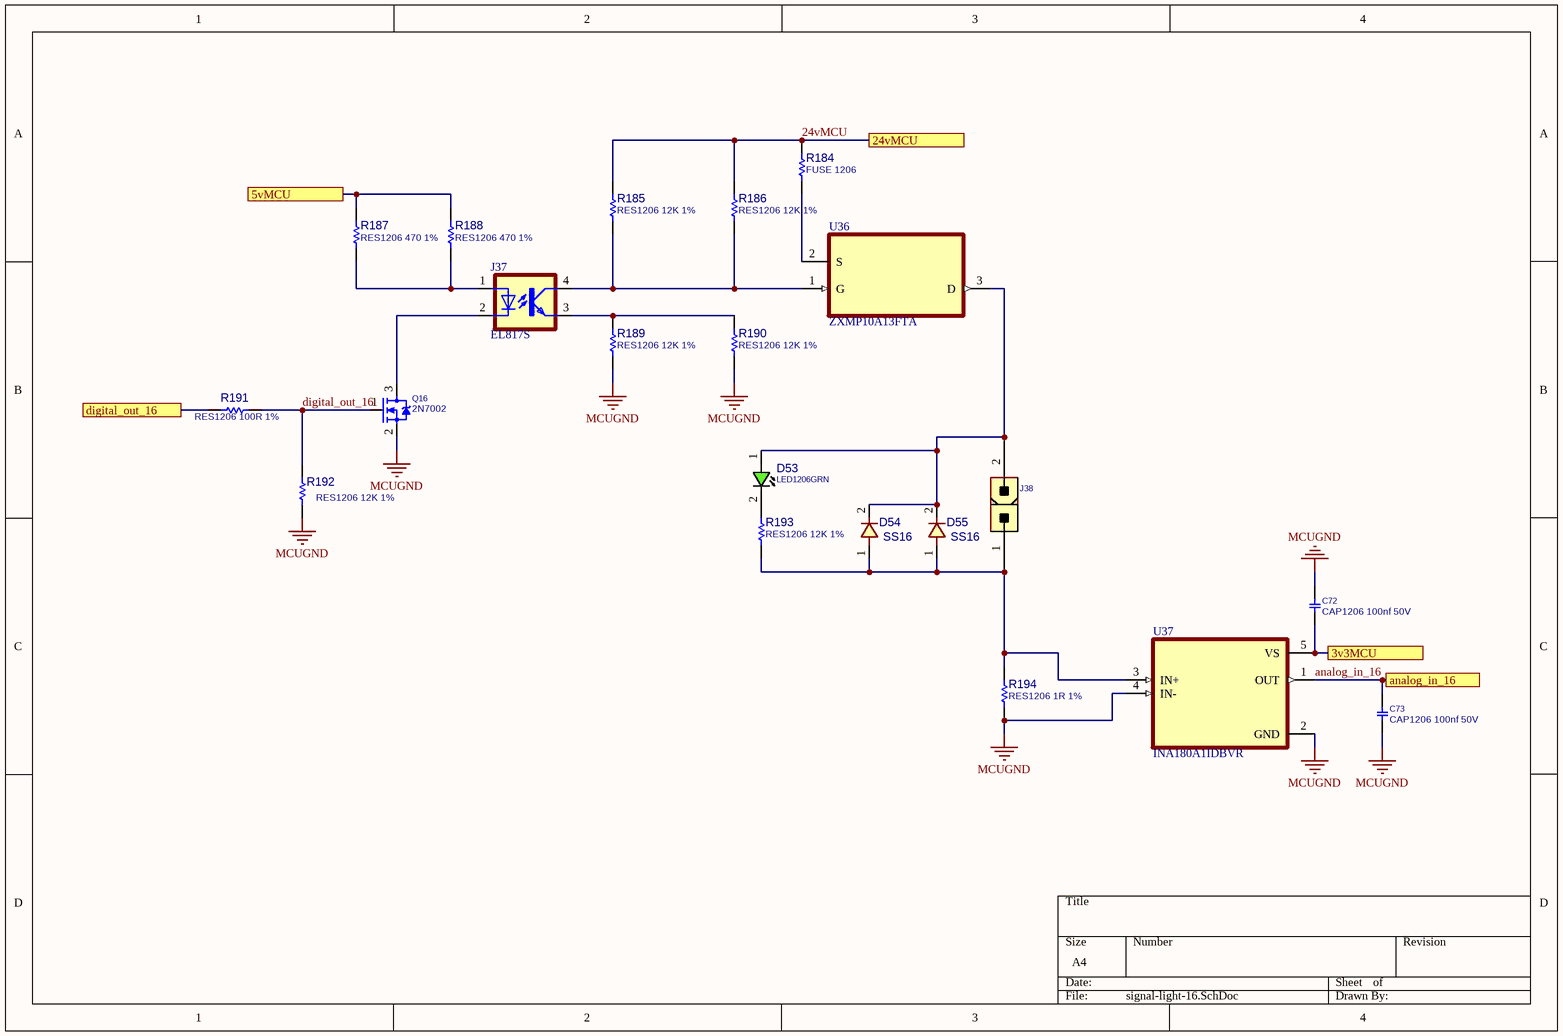
[diagram p18: signal-light-16.SchDoc]

### Parts
C72  CAP1206 100nf 50V  [C1206]
C73  CAP1206 100nf 50V  [C1206]
D53  LED1206GRN  [LED1206GRN]
D54  SS16  [D_SMA]
D55  SS16  [D_SMA]
J37  EL817S  [SOIC254P1030X460-4N]
J38  CONN_ATXPWR_2  [ATXPWR_2]  (value not drawn)
Q16  2N7002  [SOT23_3]
R184  FUSE 1206  [R1206]
R185  RES1206 12K 1%  [R1206]
R186  RES1206 12K 1%  [R1206]
R187  RES1206 470 1%  [R1206]
R188  RES1206 470 1%  [R1206]
R189  RES1206 12K 1%  [R1206]
R190  RES1206 12K 1%  [R1206]
R191  RES1206 100R 1%  [R1206]
R192  RES1206 12K 1%  [R1206]
R193  RES1206 12K 1%  [R1206]
R194  RES1206 1R 1%  [R1206]
U36  ZXMP10A13FTA  [SOT95P230X110-3N]
U37  INA180A1IDBVR  [SOT95P280X145-5N]

### Ports
3v3MCU, 5vMCU, 24vMCU, analog_in_16, digital_out_16

### Nets
MCUGND: C72.1 C73.2 Q16.2(SOURCE) R189.2 R190.2 R192.2 R194.2 U37.2(GND) U37.4(IN-)
3v3MCU: C72.2 U37.5(VS) ; port 3v3MCU
5vMCU: R187.2 R188.2 ; port 5vMCU
24vMCU: R184.1 R185.1 R186.1 ; port 24vMCU
analog_in_16: C73.1 U37.1(OUT) ; port analog_in_16
digital_out_16: Q16.1(GATE) R191.2 R192.1
NetD53_1: D53.1(ANODE) D54.2 D55.2 J38.2 U36.3(D)
NetD53_2: D53.2(CATHODE) R193.1
NetD54_1: D54.1 D55.1 J38.1 R193.2 R194.1 U37.3(IN+)
NetJ37_1: J37.1(A) R187.1 R188.1
NetJ37_2: J37.2(C) Q16.3(DRAIN)
NetJ37_3: J37.3(EMIT) R189.1 R190.1
NetJ37_4: J37.4(COL) R185.2 R186.2 U36.1(G)
NetR184_2: R184.2 U36.2(S)
NetR191_1: R191.1 ; port digital_out_16

### Library data of the parts
C72 C73 = CAP_SMD_MLCC_1206: as C60 on sheet signal-light-10; PRICE: 100= 1$; MANF: -; ASSEMBLY: ASSEMBLY
D53 = LED_SMD_1206_GRN: as D35 on sheet signal-light-10; MANF: -; ASSEMBLY: ASSEMBLY; PRICE: 36t@Javan; MANF_P#: -; VALUE: LED1206GRN; MountType: SMT; PartType: LED
D54 D55 = DIODE_SMD_1N4001: as D36 on sheet signal-light-10; MANF: MANF; ASSEMBLY: ASSEMBLY; PRICE: PRICE; VALUE: SS16
J37 = EL817S: as J25 on sheet signal-light-10; SnapEDA_Link: https://www.snapeda.com/parts/EL817S/Everlight+Electronics+Co+Ltd/view-part/?ref=snap; Package: SMD-4 Everlight Electronics Co Ltd; Value: *; MP: EL817S; Check_prices: https://www.snapeda.com/parts/EL817S/Everlight+Electronics+Co+Ltd/view-part/?ref=eda
J38 = CONN_ATXPWR_2: as J26 on sheet signal-light-10; VALUE: CONN_ATXPWR_2; MountType: THD; PACKAGE: ATXPWR-2pin; Part Type: Conn.
Q16 = MOSN_2N7002_SOT23: MOSFET, N-CH, 60V, 0.3A; MANF: NXP; ASSEMBLY: ASSEMBLY; MANF_P#: 2N7002; PARAM2: 60v; PARAM: 0.3A; PRICE: 0.3t@Javan; VALUE: 2N7002
R184-R194 = RES_SMD_1206: as R118 on sheet signal-light-10; MANF_P#: -; MANF: -; ASSEMBLY: ASSEMBLY; PRICE: -; PARAM2: -
U36 = ZXMP10A13FTA: as U24 on sheet signal-light-10; Purchase-URL: https://pricing.snapeda.com/search/part/ZXMP10A13FTA/?ref=eda; Package: SOT-23-3 Diodes Inc.; SnapEDA_Link: https://www.snapeda.com/parts/ZXMP10A13FTA/Diodes+Inc./view-part/?ref=snap; Availability: In Stock; Value: *; MP: ZXMP10A13FTA; Check_prices: https://www.snapeda.com/parts/ZXMP10A13FTA/Diodes+Inc./view-part/?ref=eda; Price: None
U37 = INA180A1IDBVR: as U25 on sheet signal-light-10; SnapEDA_Link: https://www.snapeda.com/parts/INA180A1IDBVR/Texas+Instruments/view-part/?ref=snap; Package: SOT-23-5 Texas Instruments; Value: *; MP: INA180A1IDBVR; Check_prices: https://www.snapeda.com/parts/INA180A1IDBVR/Texas+Instruments/view-part/?ref=eda

## Sheet signal-light-17.SchDoc
size A4; SheetNumber: 20; SheetTotal: 21
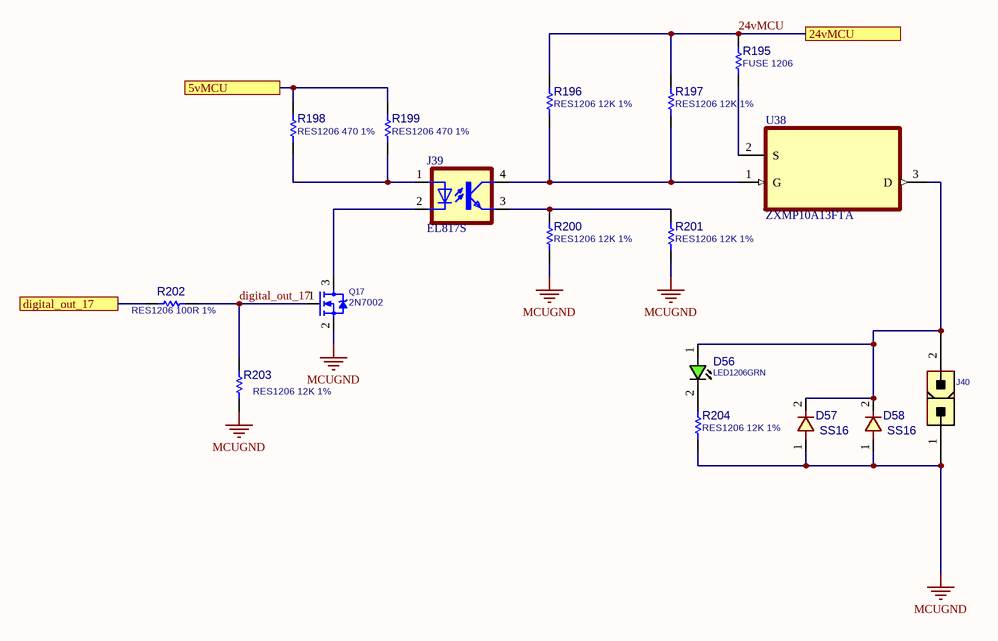
[diagram p19: signal-light-17.SchDoc]

### Parts
D56  LED1206GRN  [LED1206GRN]
D57  SS16  [D_SMA]
D58  SS16  [D_SMA]
J39  EL817S  [SOIC254P1030X460-4N]
J40  CONN_ATXPWR_2  [ATXPWR_2]  (value not drawn)
Q17  2N7002  [SOT23_3]
R195  FUSE 1206  [R1206]
R196  RES1206 12K 1%  [R1206]
R197  RES1206 12K 1%  [R1206]
R198  RES1206 470 1%  [R1206]
R199  RES1206 470 1%  [R1206]
R200  RES1206 12K 1%  [R1206]
R201  RES1206 12K 1%  [R1206]
R202  RES1206 100R 1%  [R1206]
R203  RES1206 12K 1%  [R1206]
R204  RES1206 12K 1%  [R1206]
U38  ZXMP10A13FTA  [SOT95P230X110-3N]

### Ports
5vMCU, 24vMCU, digital_out_17

### Nets
MCUGND: D57.1 D58.1 J40.1 Q17.2(SOURCE) R200.2 R201.2 R203.2 R204.2
5vMCU: R198.2 R199.2 ; port 5vMCU
24vMCU: R195.1 R196.1 R197.1 ; port 24vMCU
digital_out_17: Q17.1(GATE) R202.2 R203.1
NetD56_1: D56.1(ANODE) D57.2 D58.2 J40.2 U38.3(D)
NetD56_2: D56.2(CATHODE) R204.1
NetJ39_1: J39.1(A) R198.1 R199.1
NetJ39_2: J39.2(C) Q17.3(DRAIN)
NetJ39_3: J39.3(EMIT) R200.1 R201.1
NetJ39_4: J39.4(COL) R196.2 R197.2 U38.1(G)
NetR195_2: R195.2 U38.2(S)
NetR202_1: R202.1 ; port digital_out_17

### Library data of the parts
D56 = LED_SMD_1206_GRN: as D35 on sheet signal-light-10; MANF: -; ASSEMBLY: ASSEMBLY; PRICE: 36t@Javan; MANF_P#: -; VALUE: LED1206GRN; MountType: SMT; PartType: LED
D57 D58 = DIODE_SMD_1N4001: as D36 on sheet signal-light-10; MANF: MANF; ASSEMBLY: ASSEMBLY; PRICE: PRICE; VALUE: SS16
J39 = EL817S: as J25 on sheet signal-light-10; SnapEDA_Link: https://www.snapeda.com/parts/EL817S/Everlight+Electronics+Co+Ltd/view-part/?ref=snap; Package: SMD-4 Everlight Electronics Co Ltd; Value: *; MP: EL817S; Check_prices: https://www.snapeda.com/parts/EL817S/Everlight+Electronics+Co+Ltd/view-part/?ref=eda
J40 = CONN_ATXPWR_2: as J26 on sheet signal-light-10; VALUE: CONN_ATXPWR_2; MountType: THD; PACKAGE: ATXPWR-2pin; Part Type: Conn.
Q17 = MOSN_2N7002_SOT23: MOSFET, N-CH, 60V, 0.3A; MANF: NXP; ASSEMBLY: ASSEMBLY; MANF_P#: 2N7002; PARAM2: 60v; PARAM: 0.3A; PRICE: 0.3t@Javan; VALUE: 2N7002
R195-R204 = RES_SMD_1206: as R118 on sheet signal-light-10; MANF_P#: -; MANF: -; ASSEMBLY: ASSEMBLY; PRICE: -; PARAM2: -
U38 = ZXMP10A13FTA: as U24 on sheet signal-light-10; Purchase-URL: https://pricing.snapeda.com/search/part/ZXMP10A13FTA/?ref=eda; Package: SOT-23-3 Diodes Inc.; SnapEDA_Link: https://www.snapeda.com/parts/ZXMP10A13FTA/Diodes+Inc./view-part/?ref=snap; Availability: In Stock; Value: *; MP: ZXMP10A13FTA; Check_prices: https://www.snapeda.com/parts/ZXMP10A13FTA/Diodes+Inc./view-part/?ref=eda; Price: None

## Sheet signal-light-18.SchDoc
size A4; SheetNumber: 21; SheetTotal: 21
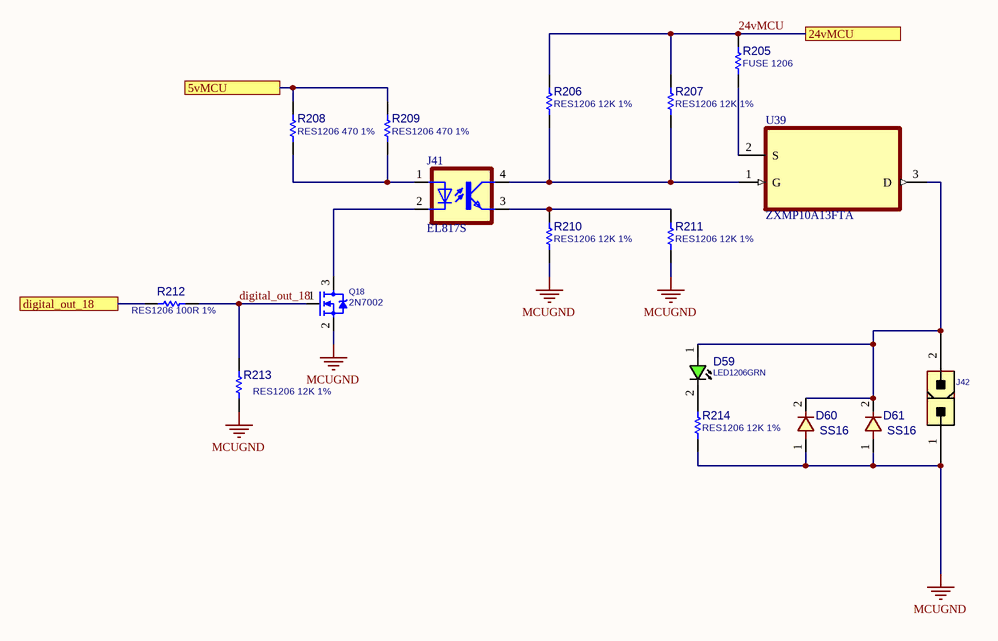
[diagram p20: signal-light-18.SchDoc]

### Parts
D59  LED1206GRN  [LED1206GRN]
D60  SS16  [D_SMA]
D61  SS16  [D_SMA]
J41  EL817S  [SOIC254P1030X460-4N]
J42  CONN_ATXPWR_2  [ATXPWR_2]  (value not drawn)
Q18  2N7002  [SOT23_3]
R205  FUSE 1206  [R1206]
R206  RES1206 12K 1%  [R1206]
R207  RES1206 12K 1%  [R1206]
R208  RES1206 470 1%  [R1206]
R209  RES1206 470 1%  [R1206]
R210  RES1206 12K 1%  [R1206]
R211  RES1206 12K 1%  [R1206]
R212  RES1206 100R 1%  [R1206]
R213  RES1206 12K 1%  [R1206]
R214  RES1206 12K 1%  [R1206]
U39  ZXMP10A13FTA  [SOT95P230X110-3N]

### Ports
5vMCU, 24vMCU, digital_out_18

### Nets
MCUGND: D60.1 D61.1 J42.1 Q18.2(SOURCE) R210.2 R211.2 R213.2 R214.2
5vMCU: R208.2 R209.2 ; port 5vMCU
24vMCU: R205.1 R206.1 R207.1 ; port 24vMCU
digital_out_18: Q18.1(GATE) R212.2 R213.1
NetD59_1: D59.1(ANODE) D60.2 D61.2 J42.2 U39.3(D)
NetD59_2: D59.2(CATHODE) R214.1
NetJ41_1: J41.1(A) R208.1 R209.1
NetJ41_2: J41.2(C) Q18.3(DRAIN)
NetJ41_3: J41.3(EMIT) R210.1 R211.1
NetJ41_4: J41.4(COL) R206.2 R207.2 U39.1(G)
NetR205_2: R205.2 U39.2(S)
NetR212_1: R212.1 ; port digital_out_18

### Library data of the parts
D59 = LED_SMD_1206_GRN: as D35 on sheet signal-light-10; MANF: -; ASSEMBLY: ASSEMBLY; PRICE: 36t@Javan; MANF_P#: -; VALUE: LED1206GRN; MountType: SMT; PartType: LED
D60 D61 = DIODE_SMD_1N4001: as D36 on sheet signal-light-10; MANF: MANF; ASSEMBLY: ASSEMBLY; PRICE: PRICE; VALUE: SS16
J41 = EL817S: as J25 on sheet signal-light-10; SnapEDA_Link: https://www.snapeda.com/parts/EL817S/Everlight+Electronics+Co+Ltd/view-part/?ref=snap; Package: SMD-4 Everlight Electronics Co Ltd; Value: *; MP: EL817S; Check_prices: https://www.snapeda.com/parts/EL817S/Everlight+Electronics+Co+Ltd/view-part/?ref=eda
J42 = CONN_ATXPWR_2: as J26 on sheet signal-light-10; VALUE: CONN_ATXPWR_2; MountType: THD; PACKAGE: ATXPWR-2pin; Part Type: Conn.
Q18 = MOSN_2N7002_SOT23: MOSFET, N-CH, 60V, 0.3A; MANF: NXP; ASSEMBLY: ASSEMBLY; MANF_P#: 2N7002; PARAM2: 60v; PARAM: 0.3A; PRICE: 0.3t@Javan; VALUE: 2N7002
R205-R214 = RES_SMD_1206: as R118 on sheet signal-light-10; MANF_P#: -; MANF: -; ASSEMBLY: ASSEMBLY; PRICE: -; PARAM2: -
U39 = ZXMP10A13FTA: as U24 on sheet signal-light-10; Purchase-URL: https://pricing.snapeda.com/search/part/ZXMP10A13FTA/?ref=eda; Package: SOT-23-3 Diodes Inc.; SnapEDA_Link: https://www.snapeda.com/parts/ZXMP10A13FTA/Diodes+Inc./view-part/?ref=snap; Availability: In Stock; Value: *; MP: ZXMP10A13FTA; Check_prices: https://www.snapeda.com/parts/ZXMP10A13FTA/Diodes+Inc./view-part/?ref=eda; Price: None

## Nets that join several sheets
MCUGND: MCU (26 pins), CAN (10 pins), power (24 pins), signal-light-1 (9 pins), signal-light-2 (9 pins), signal-light-3 (9 pins), signal-light-4 (9 pins), signal-light-5 (9 pins), signal-light-6 (9 pins), signal-light-7 (9 pins), signal-light-8 (9 pins), signal-light-9 (9 pins), signal-light-10 (9 pins), signal-light-11 (9 pins), signal-light-12 (9 pins), signal-light-13 (9 pins), signal-light-14 (9 pins), signal-light-15 (9 pins), signal-light-16 (9 pins), signal-light-17 (8 pins), signal-light-18 (8 pins)
3v3MCU: MCU (20 pins), CAN (B1.7 B2.7 C17.1 C24.1), power (6 pins), signal-light-1 (C42.2 U7.5), signal-light-2 (C44.2 U9.5), signal-light-3 (C46.2 U11.5), signal-light-4 (C48.2 U13.5), signal-light-5 (C50.2 U15.5), signal-light-6 (C52.2 U17.5), signal-light-7 (C54.2 U19.5), signal-light-8 (C56.2 U21.5), signal-light-9 (C58.2 U23.5), signal-light-10 (C60.2 U25.5), signal-light-11 (C62.2 U27.5), signal-light-12 (C64.2 U29.5), signal-light-13 (C66.2 U31.5), signal-light-14 (C68.2 U33.5), signal-light-15 (C70.2 U35.5), signal-light-16 (C72.2 U37.5)
5vMCU: MCU (FUSE_SMD1.1), CAN (6 pins), power (11 pins), signal-light-1 (R22.2 R23.2), signal-light-2 (R33.2 R34.2), signal-light-3 (R44.2 R45.2), signal-light-4 (R55.2 R56.2), signal-light-5 (R66.2 R67.2), signal-light-6 (R77.2 R78.2), signal-light-7 (R88.2 R89.2), signal-light-8 (R99.2 R100.2), signal-light-9 (R110.2 R111.2), signal-light-10 (R121.2 R122.2), signal-light-11 (R132.2 R133.2), signal-light-12 (R143.2 R144.2), signal-light-13 (R154.2 R155.2), signal-light-14 (R165.2 R166.2), signal-light-15 (R176.2 R177.2), signal-light-16 (R187.2 R188.2), signal-light-17 (R198.2 R199.2), signal-light-18 (R208.2 R209.2)
24vMCU: power (7 pins), signal-light-1 (R19.1 R20.1 R21.1), signal-light-2 (R30.1 R31.1 R32.1), signal-light-3 (R41.1 R42.1 R43.1), signal-light-4 (R52.1 R53.1 R54.1), signal-light-5 (R63.1 R64.1 R65.1), signal-light-6 (R74.1 R75.1 R76.1), signal-light-7 (R85.1 R86.1 R87.1), signal-light-8 (R96.1 R97.1 R98.1), signal-light-9 (R107.1 R108.1 R109.1), signal-light-10 (R118.1 R119.1 R120.1), signal-light-11 (R129.1 R130.1 R131.1), signal-light-12 (R140.1 R141.1 R142.1), signal-light-13 (R151.1 R152.1 R153.1), signal-light-14 (R162.1 R163.1 R164.1), signal-light-15 (R173.1 R174.1 R175.1), signal-light-16 (R184.1 R185.1 R186.1), signal-light-17 (R195.1 R196.1 R197.1), signal-light-18 (R205.1 R206.1 R207.1)
analog_in_1: MCU (U1.15), signal-light-1 (C43.1 U7.1)
analog_in_2: MCU (U1.16), signal-light-2 (C45.1 U9.1)
analog_in_3: MCU (U1.17), signal-light-3 (C47.1 U11.1)
analog_in_4: MCU (U1.18), signal-light-4 (C49.1 U13.1)
analog_in_5: MCU (U1.23), signal-light-5 (C51.1 U15.1)
analog_in_6: MCU (U1.24), signal-light-6 (C53.1 U17.1)
analog_in_7: MCU (U1.25), signal-light-7 (C55.1 U19.1)
analog_in_8: MCU (U1.26), signal-light-8 (C57.1 U21.1)
analog_in_9: MCU (U1.29), signal-light-9 (C59.1 U23.1)
analog_in_10: MCU (U1.30), signal-light-10 (C61.1 U25.1)
analog_in_11: MCU (U1.31), signal-light-11 (C63.1 U27.1)
analog_in_12: MCU (U1.32), signal-light-12 (C65.1 U29.1)
analog_in_13: MCU (U1.33), signal-light-13 (C67.1 U31.1)
analog_in_14: MCU (U1.34), signal-light-14 (C69.1 U33.1)
analog_in_15: MCU (U1.35), signal-light-15 (C71.1 U35.1)
analog_in_16: MCU (U1.36), signal-light-16 (C73.1 U37.1)
NetB1_1: MCU (U1.81), CAN (B1.1)
NetB1_4: MCU (U1.82), CAN (B1.4)
NetB2_1: MCU (U1.51), CAN (B2.1)
NetB2_4: MCU (U1.52), CAN (B2.4)
NetR26_1: MCU (U1.67), signal-light-1 (R26.1)
NetR37_1: MCU (U1.66), signal-light-2 (R37.1)
NetR48_1: MCU (U1.65), signal-light-3 (R48.1)
NetR59_1: MCU (U1.64), signal-light-4 (R59.1)
NetR70_1: MCU (U1.63), signal-light-5 (R70.1)
NetR81_1: MCU (U1.62), signal-light-6 (R81.1)
NetR92_1: MCU (U1.61), signal-light-7 (R92.1)
NetR103_1: MCU (U1.60), signal-light-8 (R103.1)
NetR114_1: MCU (U1.59), signal-light-9 (R114.1)
NetR125_1: MCU (U1.58), signal-light-10 (R125.1)
NetR136_1: MCU (U1.57), signal-light-11 (R136.1)
NetR147_1: MCU (U1.56), signal-light-12 (R147.1)
NetR158_1: MCU (U1.44), signal-light-13 (R158.1)
NetR169_1: MCU (U1.43), signal-light-14 (R169.1)
NetR180_1: MCU (U1.42), signal-light-15 (R180.1)
NetR191_1: MCU (U1.41), signal-light-16 (R191.1)
NetR202_1: MCU (U1.40), signal-light-17 (R202.1)
NetR212_1: MCU (U1.39), signal-light-18 (R212.1)